# Altium schematic sheet Nodo_Sensores.SchDoc
size A; SheetNumber: 2; SheetTotal: 3
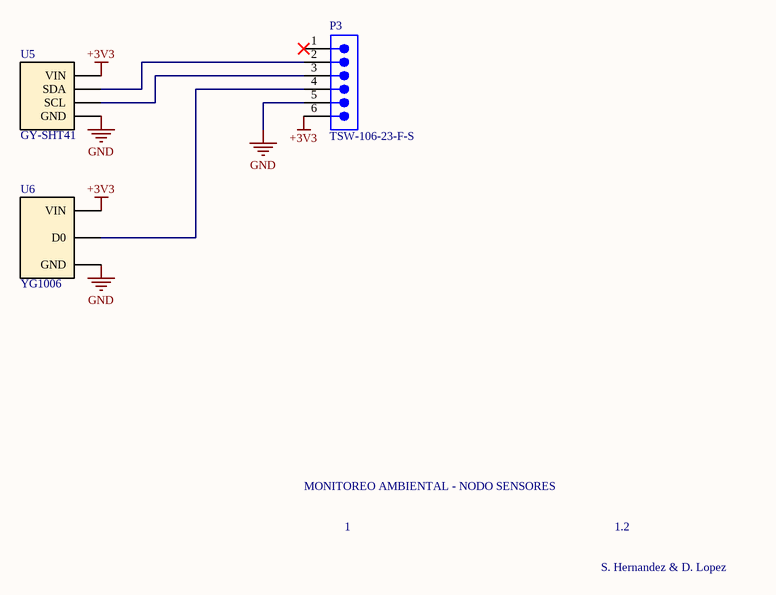
[diagram p0: Nodo_Sensores.SchDoc]

## Parts
P3  TSW-106-23-F-S  [SMTC-TSW-106-23-X-S]
U5  GY-SHT41  [SHT41]
U6  YG1006  [YG1006]

## Nets
+3V3: P3.6 U5.1(VIN) U6.1(VIN)
GND: P3.5 U5.2(GND) U6.2(GND)
NetP3_2: P3.2 U5.4(SDA)
NetP3_3: P3.3 U5.3(SCL)
NetP3_4: P3.4 U6.3(D0)

Not connected (* = marked no-connect by the designer): P3 1*

## Notes on the sheet
- MONITOREO AMBIENTAL - NODO SENSORES
- 1
- 1.2
- S. Hernandez & D. Lopez

## Library data of the parts
P3 = CMP-1024-00398-1: 0.025" SQ Post Header, Through-hole, Vertical, -55 to 125 degC, 2.54 mm Pitch, 6-Pin, Male, RoHS; Manufacturer: Samtec; Pitch: 2.54 mm; ComponentLink3Description: Package Specification; ComponentLink3URL: http://www.samtec.com/documents/webfiles/cpdf/TSW-XXX-XX-XXX-X-XX-XXX-MKT.pdf; Orientation: Vertical; ComponentLink1Description: Manufacturer URL; ComponentLink1URL: http://www.samtec.com; Mounting Technology: Through-hole; ComponentLink2URL: http://www.samtec.com/documents/webfiles/pdf/TSW_TH.PDF; PackageDescription: .025[0.64] SQ. Post Terminal Strip Assembly; PartNumber: TSW-106-23-F-S; DatasheetVersion: F-214; PackageVersion: DM, 8/1988; Temperature Range: -55 to 125 degC; ComponentLink2Description: Datasheet; RoHS: True; PackageReference: TSW-106-23-X-S